# Altium schematic sheet 08_SPI_ETHERNET.SchDoc
size A3
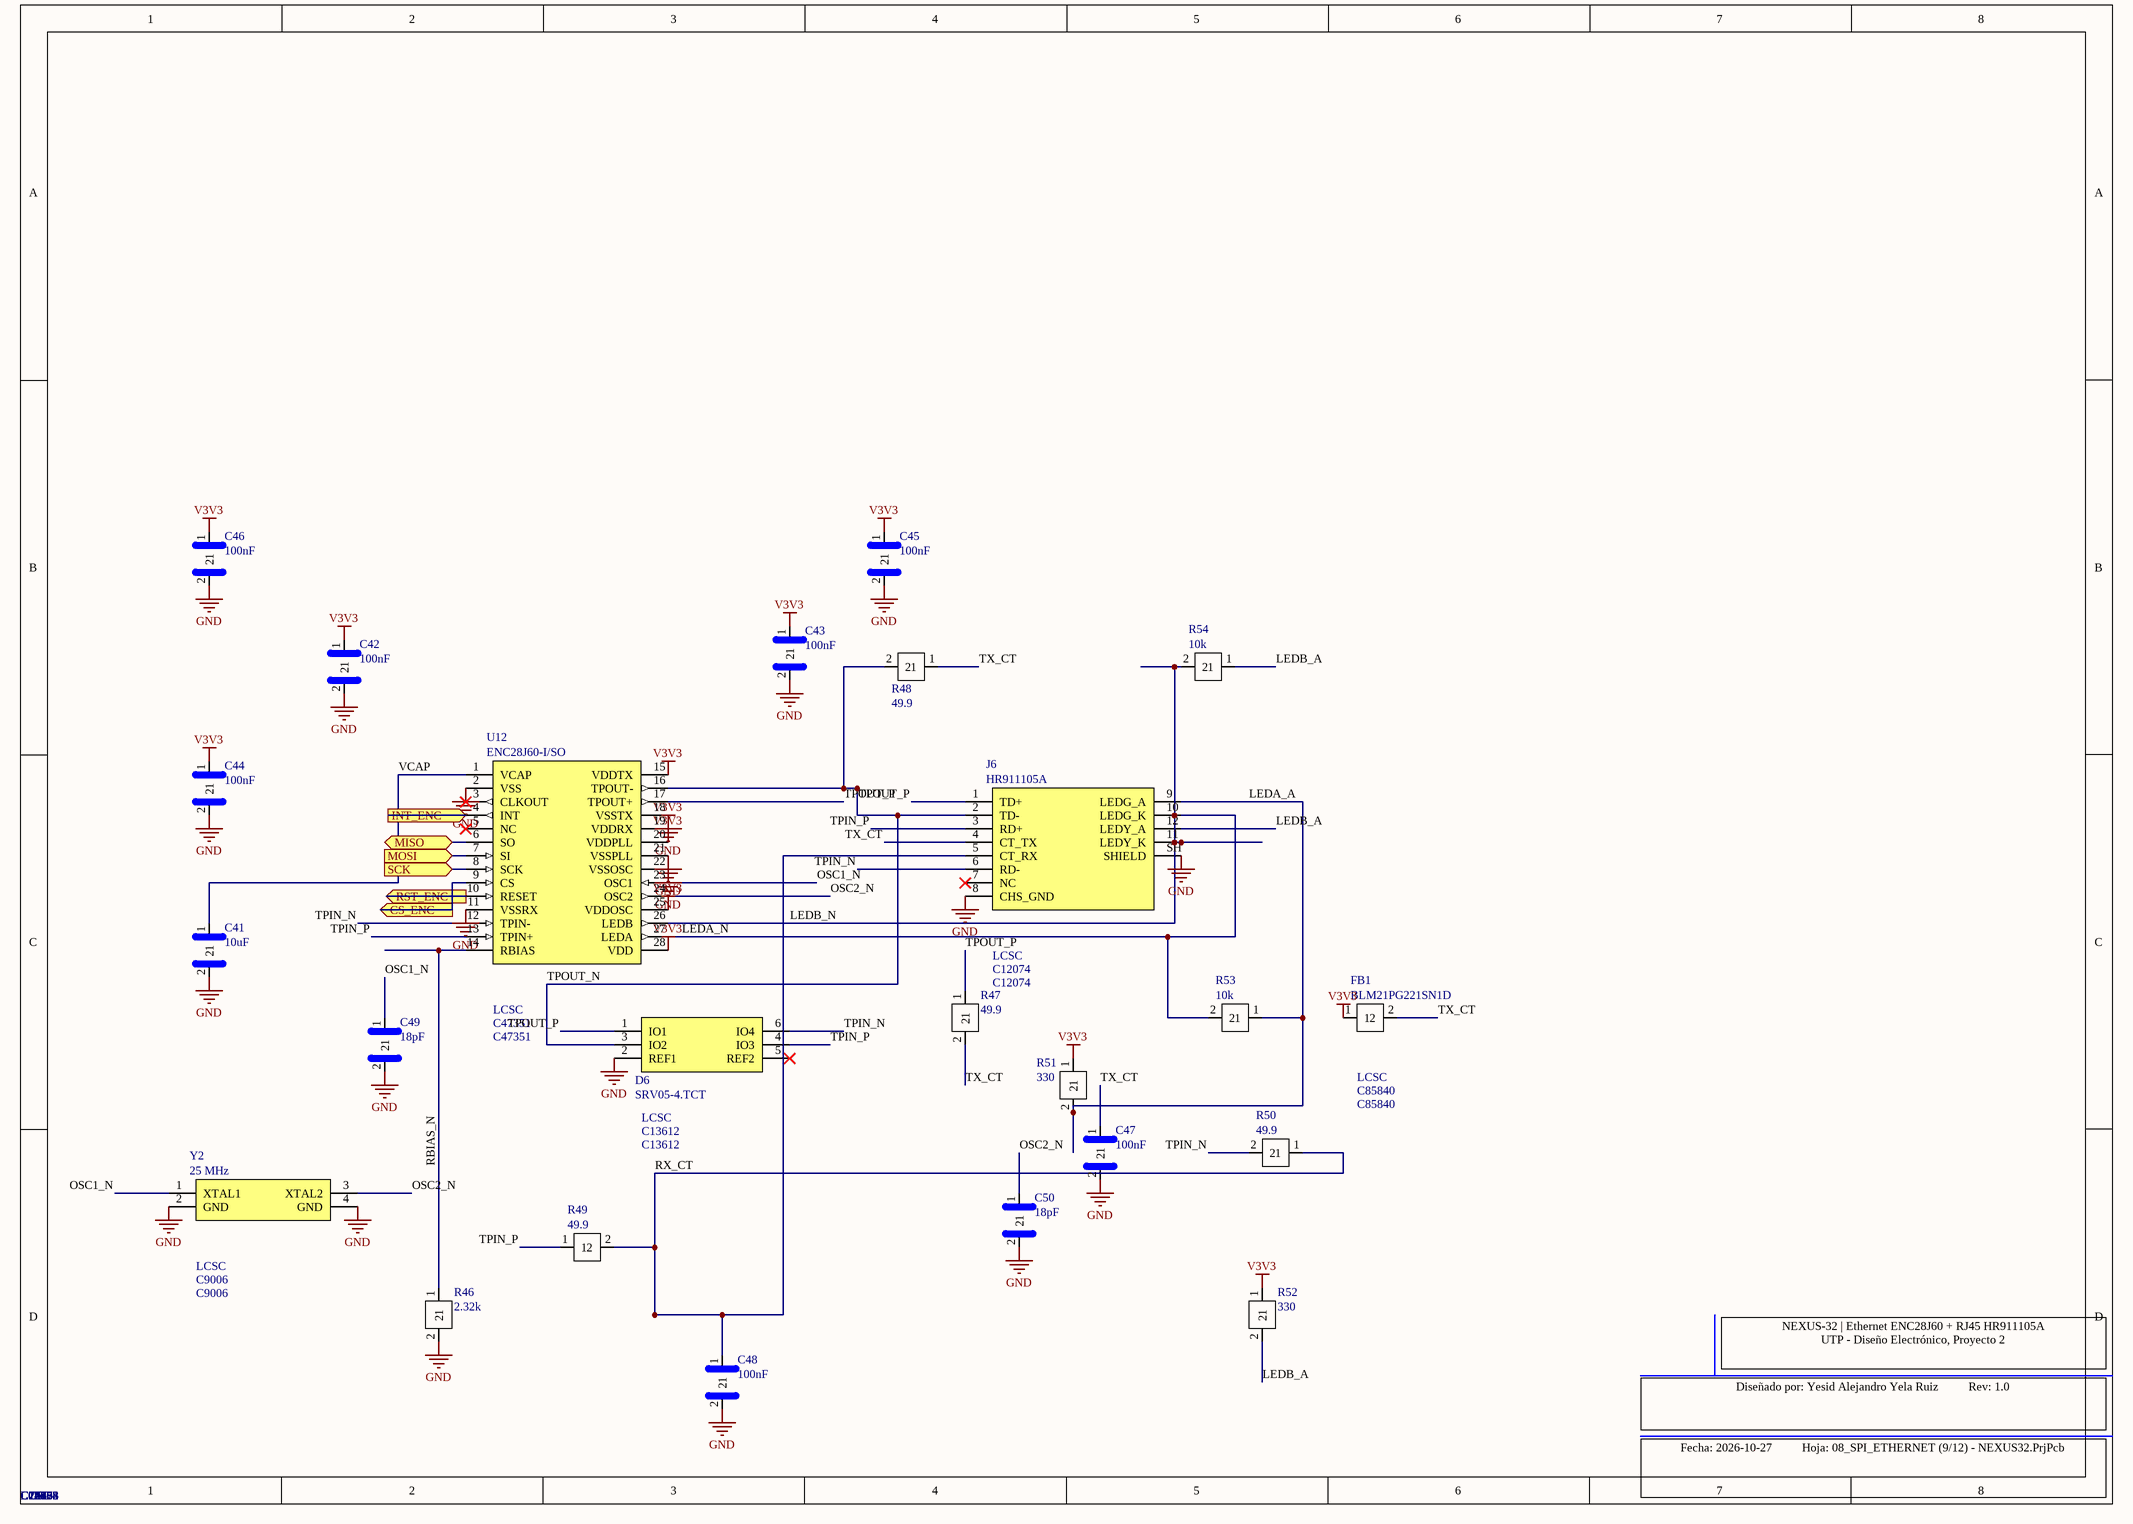
[diagram p0: 08_SPI_ETHERNET.SchDoc]

## Parts
C41  10uF  Supplier 1: LCSC  Supplier Part Number 1: C19702  [R_0603]
C42  100nF  Supplier 1: LCSC  Supplier Part Number 1: C14663  [R_0603]
C43  100nF  Supplier 1: LCSC  Supplier Part Number 1: C14663  [R_0603]
C44  100nF  Supplier 1: LCSC  Supplier Part Number 1: C14663  [R_0603]
C45  100nF  Supplier 1: LCSC  Supplier Part Number 1: C14663  [R_0603]
C46  100nF  Supplier 1: LCSC  Supplier Part Number 1: C14663  [R_0603]
C47  100nF  Supplier 1: LCSC  Supplier Part Number 1: C14663  [R_0603]
C48  100nF  Supplier 1: LCSC  Supplier Part Number 1: C14663  [R_0603]
C49  18pF  Supplier 1: LCSC  Supplier Part Number 1: C1647  [R_0603]
C50  18pF  Supplier 1: LCSC  Supplier Part Number 1: C1647  [R_0603]
D6  SRV05-4.TCT  Supplier 1: LCSC  Supplier Part Number 1: C13612  [SOT-23-6_SRV05-4]
FB1  BLM21PG221SN1D  Supplier 1: LCSC  Supplier Part Number 1: C85840  [FB_0805]
J6  HR911105A  Supplier 1: LCSC  Supplier Part Number 1: C12074  [RJ45_HR911105A]
R46  2.32k  Supplier 1: LCSC  Supplier Part Number 1: C22905  [R_0603]
R47  49.9  Supplier 1: LCSC  Supplier Part Number 1: C23185  [R_0603]
R48  49.9  Supplier 1: LCSC  Supplier Part Number 1: C23185  [R_0603]
R49  49.9  Supplier 1: LCSC  Supplier Part Number 1: C23185  [R_0603]
R50  49.9  Supplier 1: LCSC  Supplier Part Number 1: C23185  [R_0603]
R51  330  Supplier 1: LCSC  Supplier Part Number 1: C23138  [R_0603]
R52  330  Supplier 1: LCSC  Supplier Part Number 1: C23138  [R_0603]
R53  10k  Supplier 1: LCSC  Supplier Part Number 1: C25804  [R_0603]
R54  10k  Supplier 1: LCSC  Supplier Part Number 1: C25804  [R_0603]
U12  ENC28J60-I/SO  Supplier 1: LCSC  Supplier Part Number 1: C47351  [SOIC-28W_7.5x17.9_P1.27]
Y2  25 MHz  Supplier 1: LCSC  Supplier Part Number 1: C9006  [XTAL_3225_4P]

## Ports
CS_ENC (in), INT_ENC (out), MISO (bidir), MOSI (in), RST_ENC (in), SCK (in)

## Nets
GND: C41.2 C42.2 C43.2 C44.2 C45.2 C46.2 C47.2 C48.2 C49.2 C50.2 D6.2(REF1) J6.8(CHS_GND) J6.SH(SHIELD) R46.2 U12.2(VSS) U12.11(VSSRX) U12.18(VSSTX) U12.21(VSSPLL) U12.22(VSSOSC) Y2.2(GND) Y2.4(GND)
V3V3: C42.1 C43.1 C44.1 C45.1 C46.1 FB1.1 R51.1 R52.1 U12.15(VDDTX) U12.19(VDDRX) U12.20(VDDPLL) U12.25(VDDOSC) U12.28(VDD)
CS_ENC: U12.9(CS) ; port CS_ENC
INT_ENC: U12.4(INT) ; port INT_ENC
LEDA_A: J6.9(LEDG_A) R51.2 R53.1
LEDA_N: J6.10(LEDG_K) R53.2 U12.27(LEDA)
LEDB_A: J6.12(LEDY_A) R52.2 R54.1
LEDB_N: J6.11(LEDY_K) R54.2 U12.26(LEDB)
MISO: U12.6(SO) ; port MISO
MOSI: U12.7(SI) ; port MOSI
OSC1_N: C49.1 U12.23(OSC1) Y2.1(XTAL1)
OSC2_N: C50.1 U12.24(OSC2) Y2.3(XTAL2)
RBIAS_N: R46.1 U12.14(RBIAS)
RST_ENC: U12.10(RESET) ; port RST_ENC
RX_CT: C48.1 J6.5(CT_RX) R49.2 R50.1
SCK: U12.8(SCK) ; port SCK
TPIN_N: D6.6(IO4) J6.6(RD-) R50.2 U12.12(TPIN-)
TPIN_P: D6.4(IO3) J6.3(RD+) R49.1 U12.13(TPIN+)
TPOUT_N: D6.3(IO2) J6.2(TD-) R48.2 U12.16(TPOUT-)
TPOUT_P: D6.1(IO1) J6.1(TD+) R47.1 U12.17(TPOUT+)
TX_CT: C47.1 FB1.2 J6.4(CT_TX) R47.2 R48.1
VCAP: C41.1 U12.1(VCAP)

Not connected (* = marked no-connect by the designer): D6 5(REF2)*; J6 7(NC)*; U12 3(CLKOUT)* 5(NC)*

## Notes on the sheet
- NEXUS-32 | Ethernet ENC28J60 + RJ45 HR911105A
  UTP - Diseño Electrónico, Proyecto 2
- Diseñado por: Yesid Alejandro Yela Ruiz          Rev: 1.0
- Fecha: 2026-10-27          Hoja: 08_SPI_ETHERNET (9/12) - NEXUS32.PrjPcb

## Library data of the parts
C41 = CAP_0603: Condensador ceramico SMD 0603; Manufacturer: Samsung; Manufacturer Part Number: CL10A106KP8NNNC; Datasheet: https://wmsc.lcsc.com/wmsc/upload/file/pdf/v2/lcsc/2206010045_UNI-ROYAL-Uniroyal-Elec-0603WAF1002T5E_C25804.pdf; LCSC Part #: C19702
C42-C48 = CAP_0603: Condensador ceramico SMD 0603; Manufacturer: YAGEO; Manufacturer Part Number: CC0603KRX7R9BB104; Datasheet: https://wmsc.lcsc.com/wmsc/upload/file/pdf/v2/lcsc/2206010045_UNI-ROYAL-Uniroyal-Elec-0603WAF1002T5E_C25804.pdf; LCSC Part #: C14663
C49 C50 = CAP_0603: Condensador ceramico SMD 0603; Manufacturer: Samsung; Manufacturer Part Number: CL10C180JB8NNNC; Datasheet: https://wmsc.lcsc.com/wmsc/upload/file/pdf/v2/lcsc/2206010045_UNI-ROYAL-Uniroyal-Elec-0603WAF1002T5E_C25804.pdf; LCSC Part #: C1647
D6 = SRV05-4.TCT: Matriz TVS 4 lineas 5V SOT-23-6 (Semtech SRV05-4.TCT); Manufacturer: Semtech; Manufacturer Part Number: SRV05-4.TCT; LCSC Part #: C13612; Datasheet: https://wmsc.lcsc.com/wmsc/upload/file/pdf/v2/lcsc/1809212114_SEMTECH-SRV05-4-TCT_C13612.pdf
FB1 = FERRITE_0805: Ferrita 220R@100MHz 0805 (Murata BLM21PG221SN1D); Manufacturer: Murata; Manufacturer Part Number: BLM21PG221SN1D; LCSC Part #: C85840; Datasheet: https://wmsc.lcsc.com/wmsc/upload/file/pdf/v2/lcsc/2304140030_Murata-Electronics-BLM21PG221SN1D_C85840.pdf
J6 = HR911105A: RJ45 con magneticos 1CT:1CT y 2 LED, 10/100 (HanRun HR911105A); P8 = CHS GND; LED verde 9(A)-10(K), amarillo 12(A)-11(K); Manufacturer: HanRun; Manufacturer Part Number: HR911105A; LCSC Part #: C12074; Datasheet: https://wmsc.lcsc.com/wmsc/upload/file/pdf/v2/lcsc/2409302333_HANRUN-Zhongshan-HanRun-Elec-HR911105A_C12074.pdf
R46 = RES_0603: Resistencia SMD 0603; Manufacturer: UNI-ROYAL; Manufacturer Part Number: 0603WAF2321T5E; Datasheet: https://wmsc.lcsc.com/wmsc/upload/file/pdf/v2/lcsc/2206010045_UNI-ROYAL-Uniroyal-Elec-0603WAF1002T5E_C25804.pdf; LCSC Part #: C22905
R47-R50 = RES_0603: Resistencia SMD 0603; Manufacturer: UNI-ROYAL; Manufacturer Part Number: 0603WAF499JT5E; Datasheet: https://wmsc.lcsc.com/wmsc/upload/file/pdf/v2/lcsc/2206010045_UNI-ROYAL-Uniroyal-Elec-0603WAF1002T5E_C25804.pdf; LCSC Part #: C23185
R51 R52 = RES_0603: Resistencia SMD 0603; Manufacturer: UNI-ROYAL; Manufacturer Part Number: 0603WAF3300T5E; Datasheet: https://wmsc.lcsc.com/wmsc/upload/file/pdf/v2/lcsc/2206010045_UNI-ROYAL-Uniroyal-Elec-0603WAF1002T5E_C25804.pdf; LCSC Part #: C23138
R53 R54 = RES_0603: Resistencia SMD 0603; Manufacturer: UNI-ROYAL; Manufacturer Part Number: 0603WAF1002T5E; Datasheet: https://wmsc.lcsc.com/wmsc/upload/file/pdf/v2/lcsc/2206010045_UNI-ROYAL-Uniroyal-Elec-0603WAF1002T5E_C25804.pdf; LCSC Part #: C25804
U12 = ENC28J60-I/SO: Controlador Ethernet 10BASE-T SPI SOIC-28 (Microchip ENC28J60-I/SO); Manufacturer: Microchip Technology; Manufacturer Part Number: ENC28J60-I/SO; LCSC Part #: C47351; Datasheet: https://ww1.microchip.com/downloads/en/DeviceDoc/39662e.pdf
Y2 = XTAL_3225: Cristal 25MHz 12pF SMD 3225 4 pads (YXC X322525MOB4SI); terminales 1 y 3, carcasa 2 y 4 a GND; Manufacturer: YXC (Yangxing Technology); Manufacturer Part Number: X322525MOB4SI; LCSC Part #: C9006; Datasheet: https://wmsc.lcsc.com/wmsc/upload/file/pdf/v2/lcsc/2403291504_YXC-Crystal-Oscillators-X322525MOB4SI_C9006.pdf